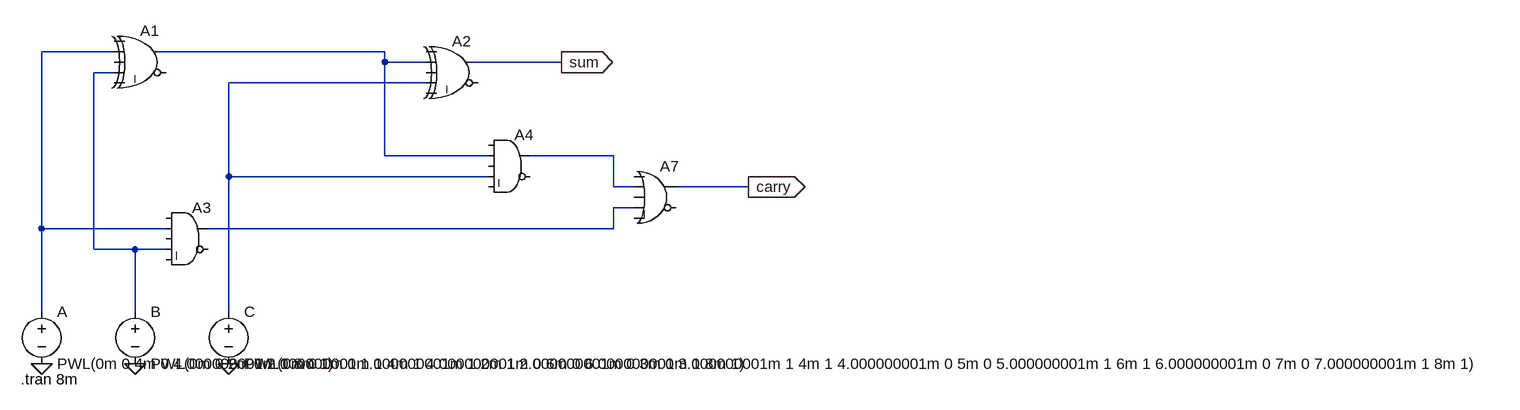
[diagram p0: schematic lab34.asc]
lab34.asc, the LTspice schematic file:
Version 4.1
SHEET 1 2072 680
WIRE -208 -32 -320 -32
WIRE 208 -32 -144 -32
WIRE 208 -16 208 -32
WIRE 272 -16 208 -16
WIRE 480 -16 336 -16
WIRE -208 0 -240 0
WIRE 272 16 -32 16
WIRE 208 128 208 -16
WIRE 368 128 208 128
WIRE 560 128 432 128
WIRE -32 160 -32 16
WIRE 368 160 -32 160
WIRE 560 176 560 128
WIRE 592 176 560 176
WIRE 768 176 656 176
WIRE 592 208 560 208
WIRE -320 240 -320 -32
WIRE -128 240 -320 240
WIRE 560 240 560 208
WIRE 560 240 -64 240
WIRE -240 272 -240 0
WIRE -176 272 -240 272
WIRE -128 272 -176 272
WIRE -320 368 -320 240
WIRE -176 368 -176 272
WIRE -32 368 -32 160
FLAG -320 448 0
FLAG -176 448 0
FLAG -32 448 0
FLAG 768 176 carry
IOPIN 768 176 Out
FLAG 480 -16 sum
IOPIN 480 -16 Out
SYMBOL voltage -32 352 R0
WINDOW 123 0 0 Left 0
WINDOW 39 0 0 Left 0
SYMATTR InstName C
SYMATTR Value PWL(0m 0 1m 0 1.000000001m 1 2m 1 2.000000001m 0 3m 0 3.000000001m 1 4m 1 4.000000001m 0 5m 0 5.000000001m 1 6m 1 6.000000001m 0 7m 0 7.000000001m 1 8m 1)
SYMBOL voltage -176 352 R0
WINDOW 123 0 0 Left 0
WINDOW 39 0 0 Left 0
SYMATTR InstName B
SYMATTR Value PWL(0m 0 2m 0 2.000000001m 1 4m 1 4.000000001m 0 6m 0 6.000000001m 1 8m 1)
SYMBOL voltage -320 352 R0
WINDOW 123 0 0 Left 0
WINDOW 39 0 0 Left 0
SYMATTR InstName A
SYMATTR Value PWL(0m 0 4m 0 4.000000001m 1 8m 1)
SYMBOL Digital\\xor -160 -80 R0
SYMATTR InstName A1
SYMBOL Digital\\xor 320 -64 R0
SYMATTR InstName A2
SYMBOL Digital\\and -96 192 R0
SYMATTR InstName A3
SYMBOL Digital\\and 400 80 R0
SYMATTR InstName A4
SYMBOL Digital\\or 624 128 R0
SYMATTR InstName A7
TEXT -352 472 Left 2 !.tran 8m

The netlist it stands for:
* lab34.asc
V§C N004 0 PWL(0m 0 1m 0 1.000000001m 1 2m 1 2.000000001m 0 3m 0 3.000000001m 1 4m 1 4.000000001m 0 5m 0 5.000000001m 1 6m 1 6.000000001m 0 7m 0 7.000000001m 1 8m 1)
V§B N003 0 PWL(0m 0 2m 0 2.000000001m 1 4m 1 4.000000001m 0 6m 0 6.000000001m 1 8m 1)
V§A N001 0 PWL(0m 0 4m 0 4.000000001m 1 8m 1)
A1 0 N001 0 N003 0 0 N002 0 XOR
A2 0 N002 0 N004 0 0 sum 0 XOR
A3 0 N001 0 N003 0 0 N006 0 AND
A4 0 N002 0 N004 0 0 N005 0 AND
A7 0 N005 0 N006 0 0 carry 0 OR
.tran 8m
.backanno
.end